# Altium schematic sheet 810nm-LED-Sheet.SchDoc
size 420 x 297 mm; SheetNumber: 4; SheetTotal: 6
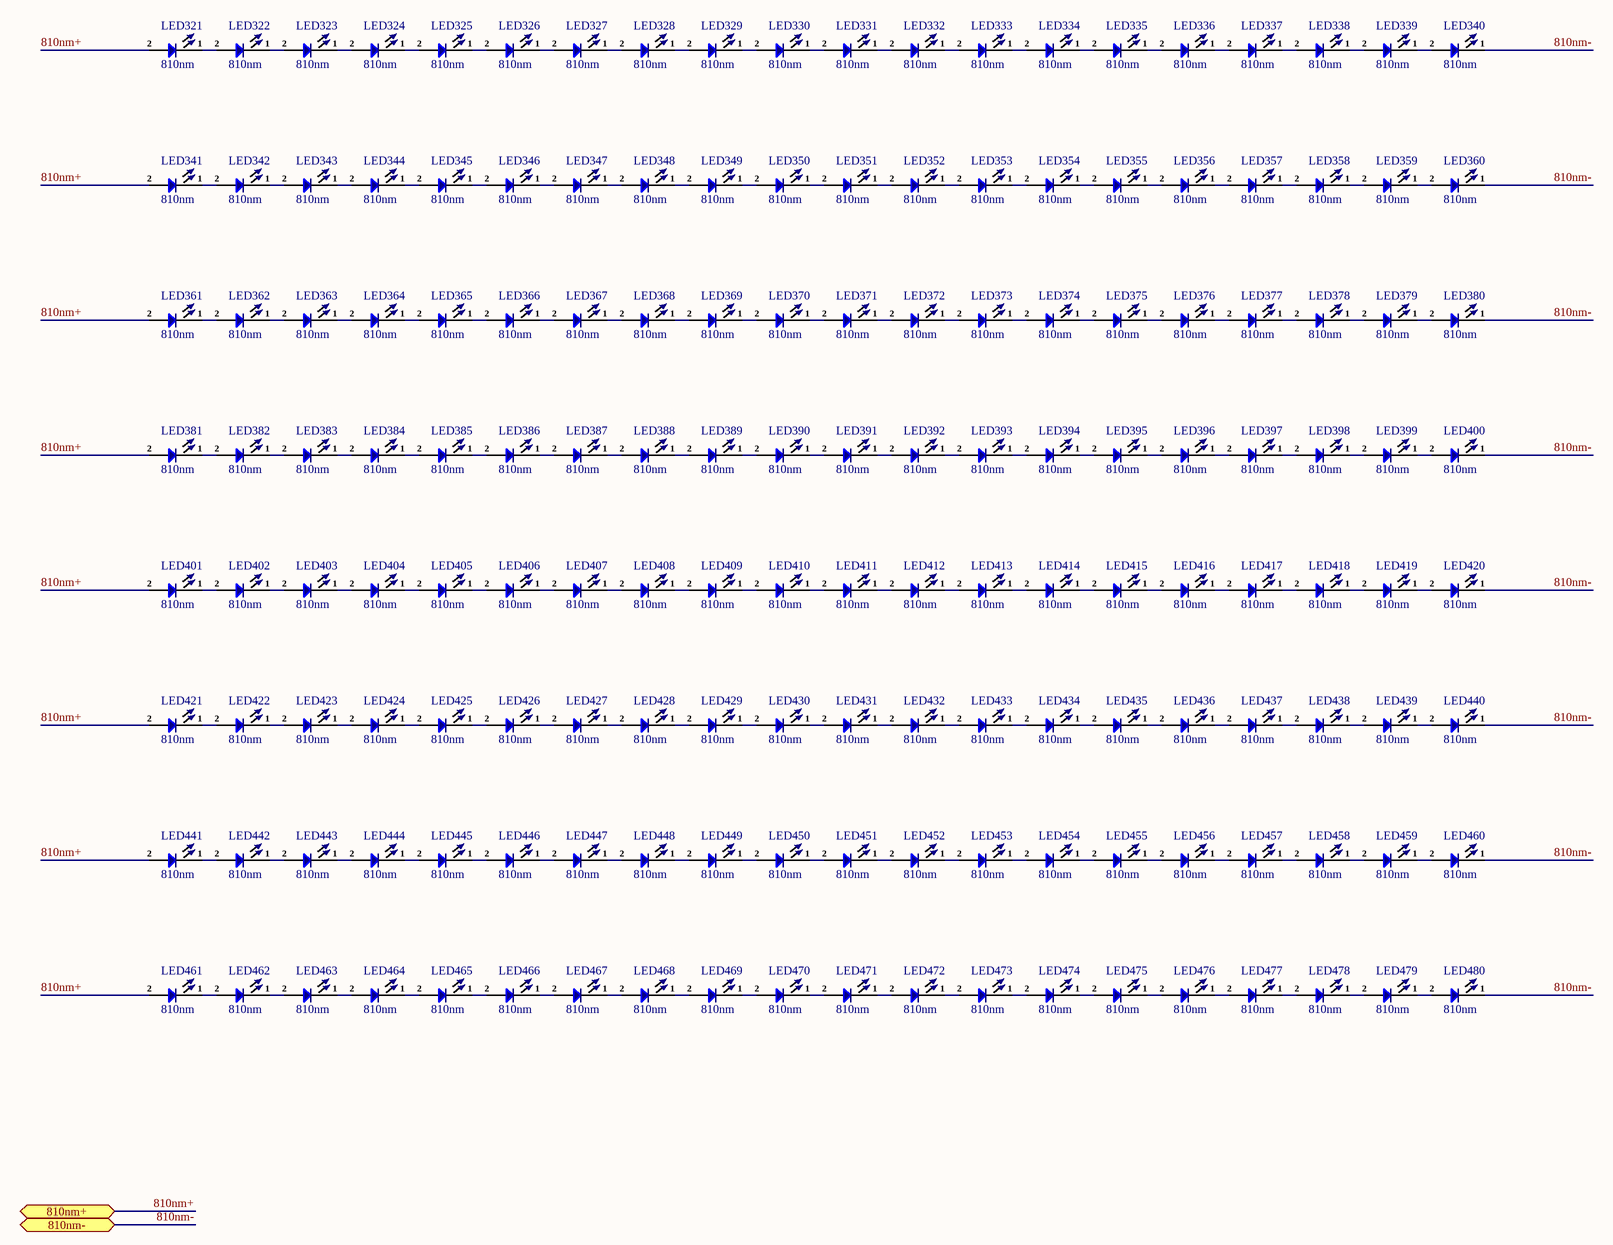
[diagram p0: 810nm-LED-Sheet.SchDoc]

## Parts
LED321  810nm  [TH LED 3mm_]
LED322  810nm  [TH LED 3mm_]
LED323  810nm  [TH LED 3mm_]
LED324  810nm  [TH LED 3mm_]
LED325  810nm  [TH LED 3mm_]
LED326  810nm  [TH LED 3mm_]
LED327  810nm  [TH LED 3mm_]
LED328  810nm  [TH LED 3mm_]
LED329  810nm  [TH LED 3mm_]
LED330  810nm  [TH LED 3mm_]
LED331  810nm  [TH LED 3mm_]
LED332  810nm  [TH LED 3mm_]
LED333  810nm  [TH LED 3mm_]
LED334  810nm  [TH LED 3mm_]
LED335  810nm  [TH LED 3mm_]
LED336  810nm  [TH LED 3mm_]
LED337  810nm  [TH LED 3mm_]
LED338  810nm  [TH LED 3mm_]
LED339  810nm  [TH LED 3mm_]
LED340  810nm  [TH LED 3mm_]
LED341  810nm  [TH LED 3mm_]
LED342  810nm  [TH LED 3mm_]
LED343  810nm  [TH LED 3mm_]
LED344  810nm  [TH LED 3mm_]
LED345  810nm  [TH LED 3mm_]
LED346  810nm  [TH LED 3mm_]
LED347  810nm  [TH LED 3mm_]
LED348  810nm  [TH LED 3mm_]
LED349  810nm  [TH LED 3mm_]
LED350  810nm  [TH LED 3mm_]
LED351  810nm  [TH LED 3mm_]
LED352  810nm  [TH LED 3mm_]
LED353  810nm  [TH LED 3mm_]
LED354  810nm  [TH LED 3mm_]
LED355  810nm  [TH LED 3mm_]
LED356  810nm  [TH LED 3mm_]
LED357  810nm  [TH LED 3mm_]
LED358  810nm  [TH LED 3mm_]
LED359  810nm  [TH LED 3mm_]
LED360  810nm  [TH LED 3mm_]
LED361  810nm  [TH LED 3mm_]
LED362  810nm  [TH LED 3mm_]
LED363  810nm  [TH LED 3mm_]
LED364  810nm  [TH LED 3mm_]
LED365  810nm  [TH LED 3mm_]
LED366  810nm  [TH LED 3mm_]
LED367  810nm  [TH LED 3mm_]
LED368  810nm  [TH LED 3mm_]
LED369  810nm  [TH LED 3mm_]
LED370  810nm  [TH LED 3mm_]
LED371  810nm  [TH LED 3mm_]
LED372  810nm  [TH LED 3mm_]
LED373  810nm  [TH LED 3mm_]
LED374  810nm  [TH LED 3mm_]
LED375  810nm  [TH LED 3mm_]
LED376  810nm  [TH LED 3mm_]
LED377  810nm  [TH LED 3mm_]
LED378  810nm  [TH LED 3mm_]
LED379  810nm  [TH LED 3mm_]
LED380  810nm  [TH LED 3mm_]
LED381  810nm  [TH LED 3mm_]
LED382  810nm  [TH LED 3mm_]
LED383  810nm  [TH LED 3mm_]
LED384  810nm  [TH LED 3mm_]
LED385  810nm  [TH LED 3mm_]
LED386  810nm  [TH LED 3mm_]
LED387  810nm  [TH LED 3mm_]
LED388  810nm  [TH LED 3mm_]
LED389  810nm  [TH LED 3mm_]
LED390  810nm  [TH LED 3mm_]
LED391  810nm  [TH LED 3mm_]
LED392  810nm  [TH LED 3mm_]
LED393  810nm  [TH LED 3mm_]
LED394  810nm  [TH LED 3mm_]
LED395  810nm  [TH LED 3mm_]
LED396  810nm  [TH LED 3mm_]
LED397  810nm  [TH LED 3mm_]
LED398  810nm  [TH LED 3mm_]
LED399  810nm  [TH LED 3mm_]
LED400  810nm  [TH LED 3mm_]
LED401  810nm  [TH LED 3mm_]
LED402  810nm  [TH LED 3mm_]
LED403  810nm  [TH LED 3mm_]
LED404  810nm  [TH LED 3mm_]
LED405  810nm  [TH LED 3mm_]
LED406  810nm  [TH LED 3mm_]
LED407  810nm  [TH LED 3mm_]
LED408  810nm  [TH LED 3mm_]
LED409  810nm  [TH LED 3mm_]
LED410  810nm  [TH LED 3mm_]
LED411  810nm  [TH LED 3mm_]
LED412  810nm  [TH LED 3mm_]
LED413  810nm  [TH LED 3mm_]
LED414  810nm  [TH LED 3mm_]
LED415  810nm  [TH LED 3mm_]
LED416  810nm  [TH LED 3mm_]
LED417  810nm  [TH LED 3mm_]
LED418  810nm  [TH LED 3mm_]
LED419  810nm  [TH LED 3mm_]
LED420  810nm  [TH LED 3mm_]
LED421  810nm  [TH LED 3mm_]
LED422  810nm  [TH LED 3mm_]
LED423  810nm  [TH LED 3mm_]
LED424  810nm  [TH LED 3mm_]
LED425  810nm  [TH LED 3mm_]
LED426  810nm  [TH LED 3mm_]
LED427  810nm  [TH LED 3mm_]
LED428  810nm  [TH LED 3mm_]
LED429  810nm  [TH LED 3mm_]
LED430  810nm  [TH LED 3mm_]
LED431  810nm  [TH LED 3mm_]
LED432  810nm  [TH LED 3mm_]
LED433  810nm  [TH LED 3mm_]
LED434  810nm  [TH LED 3mm_]
LED435  810nm  [TH LED 3mm_]
LED436  810nm  [TH LED 3mm_]
LED437  810nm  [TH LED 3mm_]
LED438  810nm  [TH LED 3mm_]
LED439  810nm  [TH LED 3mm_]
LED440  810nm  [TH LED 3mm_]
LED441  810nm  [TH LED 3mm_]
LED442  810nm  [TH LED 3mm_]
LED443  810nm  [TH LED 3mm_]
LED444  810nm  [TH LED 3mm_]
LED445  810nm  [TH LED 3mm_]
LED446  810nm  [TH LED 3mm_]
LED447  810nm  [TH LED 3mm_]
LED448  810nm  [TH LED 3mm_]
LED449  810nm  [TH LED 3mm_]
LED450  810nm  [TH LED 3mm_]
LED451  810nm  [TH LED 3mm_]
LED452  810nm  [TH LED 3mm_]
LED453  810nm  [TH LED 3mm_]
LED454  810nm  [TH LED 3mm_]
LED455  810nm  [TH LED 3mm_]
LED456  810nm  [TH LED 3mm_]
LED457  810nm  [TH LED 3mm_]
LED458  810nm  [TH LED 3mm_]
LED459  810nm  [TH LED 3mm_]
LED460  810nm  [TH LED 3mm_]
LED461  810nm  [TH LED 3mm_]
LED462  810nm  [TH LED 3mm_]
LED463  810nm  [TH LED 3mm_]
LED464  810nm  [TH LED 3mm_]
LED465  810nm  [TH LED 3mm_]
LED466  810nm  [TH LED 3mm_]
LED467  810nm  [TH LED 3mm_]
LED468  810nm  [TH LED 3mm_]
LED469  810nm  [TH LED 3mm_]
LED470  810nm  [TH LED 3mm_]
LED471  810nm  [TH LED 3mm_]
LED472  810nm  [TH LED 3mm_]
LED473  810nm  [TH LED 3mm_]
LED474  810nm  [TH LED 3mm_]
LED475  810nm  [TH LED 3mm_]
LED476  810nm  [TH LED 3mm_]
LED477  810nm  [TH LED 3mm_]
LED478  810nm  [TH LED 3mm_]
LED479  810nm  [TH LED 3mm_]
LED480  810nm  [TH LED 3mm_]

## Ports
810nm+ (bidir, see Main-Sheet[4B]), 810nm- (bidir, see Main-Sheet[4C])

## Nets
810nm+: LED321.2 LED341.2 LED361.2 LED381.2 LED401.2 LED421.2 LED441.2 LED461.2 ; port 810nm+
810nm-: LED340.1 LED360.1 LED380.1 LED400.1 LED420.1 LED440.1 LED460.1 LED480.1 ; port 810nm-
NetLED321_1: LED321.1 LED322.2
NetLED322_1: LED322.1 LED323.2
NetLED323_1: LED323.1 LED324.2
NetLED324_1: LED324.1 LED325.2
NetLED325_1: LED325.1 LED326.2
NetLED326_1: LED326.1 LED327.2
NetLED327_1: LED327.1 LED328.2
NetLED328_1: LED328.1 LED329.2
NetLED329_1: LED329.1 LED330.2
NetLED330_1: LED330.1 LED331.2
NetLED331_1: LED331.1 LED332.2
NetLED332_1: LED332.1 LED333.2
NetLED333_1: LED333.1 LED334.2
NetLED334_1: LED334.1 LED335.2
NetLED335_1: LED335.1 LED336.2
NetLED336_1: LED336.1 LED337.2
NetLED337_1: LED337.1 LED338.2
NetLED338_1: LED338.1 LED339.2
NetLED339_1: LED339.1 LED340.2
NetLED341_1: LED341.1 LED342.2
NetLED342_1: LED342.1 LED343.2
NetLED343_1: LED343.1 LED344.2
NetLED344_1: LED344.1 LED345.2
NetLED345_1: LED345.1 LED346.2
NetLED346_1: LED346.1 LED347.2
NetLED347_1: LED347.1 LED348.2
NetLED348_1: LED348.1 LED349.2
NetLED349_1: LED349.1 LED350.2
NetLED350_1: LED350.1 LED351.2
NetLED351_1: LED351.1 LED352.2
NetLED352_1: LED352.1 LED353.2
NetLED353_1: LED353.1 LED354.2
NetLED354_1: LED354.1 LED355.2
NetLED355_1: LED355.1 LED356.2
NetLED356_1: LED356.1 LED357.2
NetLED357_1: LED357.1 LED358.2
NetLED358_1: LED358.1 LED359.2
NetLED359_1: LED359.1 LED360.2
NetLED361_1: LED361.1 LED362.2
NetLED362_1: LED362.1 LED363.2
NetLED363_1: LED363.1 LED364.2
NetLED364_1: LED364.1 LED365.2
NetLED365_1: LED365.1 LED366.2
NetLED366_1: LED366.1 LED367.2
NetLED367_1: LED367.1 LED368.2
NetLED368_1: LED368.1 LED369.2
NetLED369_1: LED369.1 LED370.2
NetLED370_1: LED370.1 LED371.2
NetLED371_1: LED371.1 LED372.2
NetLED372_1: LED372.1 LED373.2
NetLED373_1: LED373.1 LED374.2
NetLED374_1: LED374.1 LED375.2
NetLED375_1: LED375.1 LED376.2
NetLED376_1: LED376.1 LED377.2
NetLED377_1: LED377.1 LED378.2
NetLED378_1: LED378.1 LED379.2
NetLED379_1: LED379.1 LED380.2
NetLED381_1: LED381.1 LED382.2
NetLED382_1: LED382.1 LED383.2
NetLED383_1: LED383.1 LED384.2
NetLED384_1: LED384.1 LED385.2
NetLED385_1: LED385.1 LED386.2
NetLED386_1: LED386.1 LED387.2
NetLED387_1: LED387.1 LED388.2
NetLED388_1: LED388.1 LED389.2
NetLED389_1: LED389.1 LED390.2
NetLED390_1: LED390.1 LED391.2
NetLED391_1: LED391.1 LED392.2
NetLED392_1: LED392.1 LED393.2
NetLED393_1: LED393.1 LED394.2
NetLED394_1: LED394.1 LED395.2
NetLED395_1: LED395.1 LED396.2
NetLED396_1: LED396.1 LED397.2
NetLED397_1: LED397.1 LED398.2
NetLED398_1: LED398.1 LED399.2
NetLED399_1: LED399.1 LED400.2
NetLED401_1: LED401.1 LED402.2
NetLED402_1: LED402.1 LED403.2
NetLED403_1: LED403.1 LED404.2
NetLED404_1: LED404.1 LED405.2
NetLED405_1: LED405.1 LED406.2
NetLED406_1: LED406.1 LED407.2
NetLED407_1: LED407.1 LED408.2
NetLED408_1: LED408.1 LED409.2
NetLED409_1: LED409.1 LED410.2
NetLED410_1: LED410.1 LED411.2
NetLED411_1: LED411.1 LED412.2
NetLED412_1: LED412.1 LED413.2
NetLED413_1: LED413.1 LED414.2
NetLED414_1: LED414.1 LED415.2
NetLED415_1: LED415.1 LED416.2
NetLED416_1: LED416.1 LED417.2
NetLED417_1: LED417.1 LED418.2
NetLED418_1: LED418.1 LED419.2
NetLED419_1: LED419.1 LED420.2
NetLED421_1: LED421.1 LED422.2
NetLED422_1: LED422.1 LED423.2
NetLED423_1: LED423.1 LED424.2
NetLED424_1: LED424.1 LED425.2
NetLED425_1: LED425.1 LED426.2
NetLED426_1: LED426.1 LED427.2
NetLED427_1: LED427.1 LED428.2
NetLED428_1: LED428.1 LED429.2
NetLED429_1: LED429.1 LED430.2
NetLED430_1: LED430.1 LED431.2
NetLED431_1: LED431.1 LED432.2
NetLED432_1: LED432.1 LED433.2
NetLED433_1: LED433.1 LED434.2
NetLED434_1: LED434.1 LED435.2
NetLED435_1: LED435.1 LED436.2
NetLED436_1: LED436.1 LED437.2
NetLED437_1: LED437.1 LED438.2
NetLED438_1: LED438.1 LED439.2
NetLED439_1: LED439.1 LED440.2
NetLED441_1: LED441.1 LED442.2
NetLED442_1: LED442.1 LED443.2
NetLED443_1: LED443.1 LED444.2
NetLED444_1: LED444.1 LED445.2
NetLED445_1: LED445.1 LED446.2
NetLED446_1: LED446.1 LED447.2
NetLED447_1: LED447.1 LED448.2
NetLED448_1: LED448.1 LED449.2
NetLED449_1: LED449.1 LED450.2
NetLED450_1: LED450.1 LED451.2
NetLED451_1: LED451.1 LED452.2
NetLED452_1: LED452.1 LED453.2
NetLED453_1: LED453.1 LED454.2
NetLED454_1: LED454.1 LED455.2
NetLED455_1: LED455.1 LED456.2
NetLED456_1: LED456.1 LED457.2
NetLED457_1: LED457.1 LED458.2
NetLED458_1: LED458.1 LED459.2
NetLED459_1: LED459.1 LED460.2
NetLED461_1: LED461.1 LED462.2
NetLED462_1: LED462.1 LED463.2
NetLED463_1: LED463.1 LED464.2
NetLED464_1: LED464.1 LED465.2
NetLED465_1: LED465.1 LED466.2
NetLED466_1: LED466.1 LED467.2
NetLED467_1: LED467.1 LED468.2
NetLED468_1: LED468.1 LED469.2
NetLED469_1: LED469.1 LED470.2
NetLED470_1: LED470.1 LED471.2
NetLED471_1: LED471.1 LED472.2
NetLED472_1: LED472.1 LED473.2
NetLED473_1: LED473.1 LED474.2
NetLED474_1: LED474.1 LED475.2
NetLED475_1: LED475.1 LED476.2
NetLED476_1: LED476.1 LED477.2
NetLED477_1: LED477.1 LED478.2
NetLED478_1: LED478.1 LED479.2
NetLED479_1: LED479.1 LED480.2

## Notes on the sheet
- File:
- Title:
- Date:
- Page
- Num:
- Total:
- Drawn By: Huzaifa Ali

## Library data of the parts
LED321-LED480 = IR LED 3mm: IR Led 3mm Through; ComponentLink1Description: Aliexpress; ComponentLink1URL: https://nl.aliexpress.com/item/32950109432.html?spm=a2g0o.productlist.0.0.2d9749ecxdTGvK&algo_pvid=f3c88197-d0dd-4360-badc-ef5a9d1d435b&algo_exp_id=f3c88197-d0dd-4360-badc-ef5a9d1d435b-1&pdp_ext_f=%7B%22sku_id%22%3A%2266309321327%22%7D